# Altium schematic sheet FoxSky.Janus.SchDoc
size A4; SheetNumber: 1; SheetTotal: 6
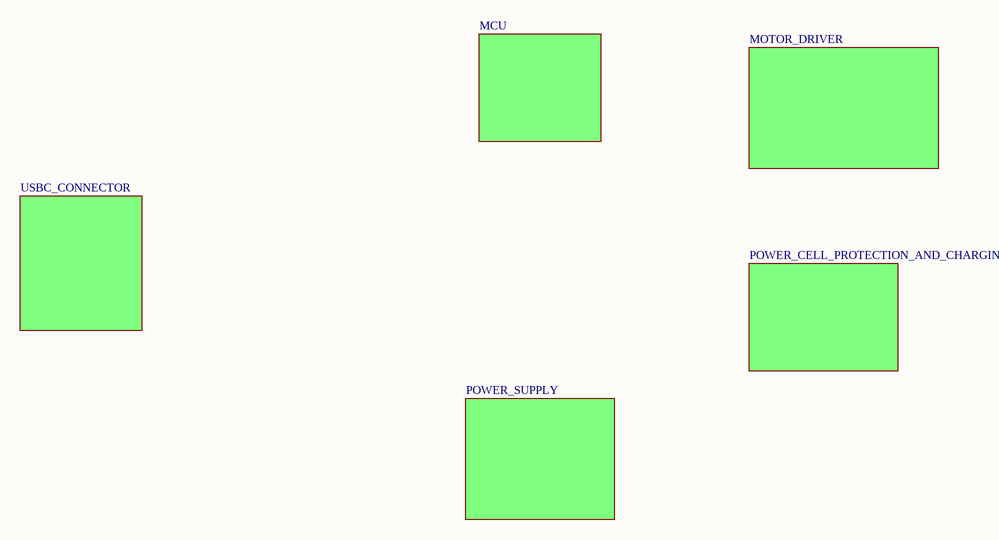
[diagram p0: FoxSky.Janus.SchDoc]

## Sub-sheets
Designator = MCU: no entries
Designator = POWER_CELL_PROTECTION_AND_CHARGING: no entries
Designator = POWER_SUPPLY: no entries
Designator = MOTOR_DRIVER: no entries
Designator = USBC_CONNECTOR: no entries